# Altium schematic sheet Top_Sheet.SchDoc
size 420 x 297 mm; SheetNumber: 1; SheetTotal: 5
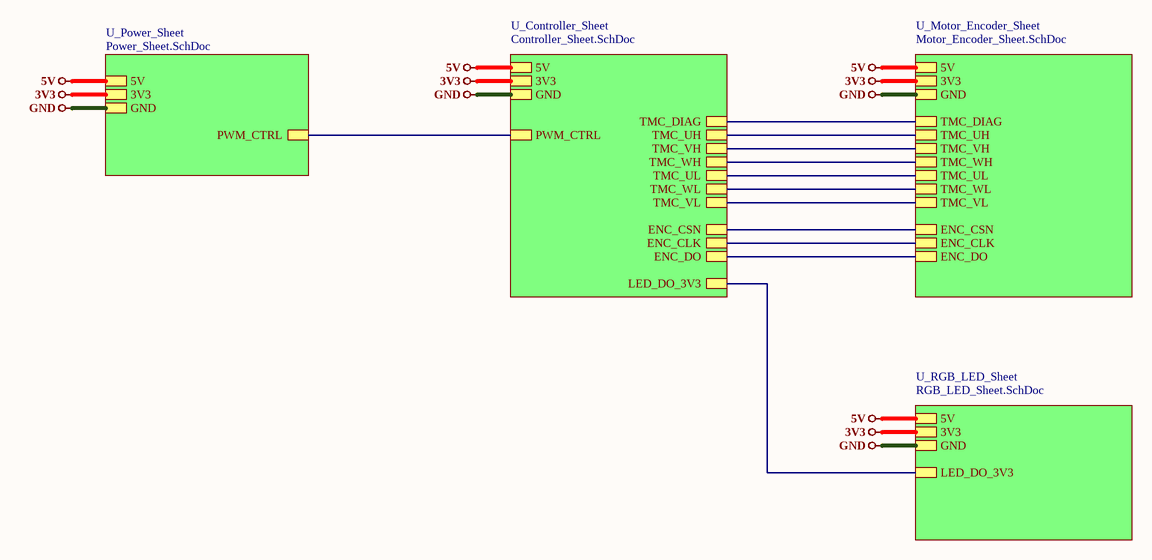
[diagram p0: Top_Sheet.SchDoc]

## Sub-sheets
U_Controller_Sheet = Controller_Sheet.SchDoc: 3V3, GND, 5V, TMC_UH, TMC_VH, TMC_WH, TMC_UL, TMC_WL, TMC_VL, ENC_CSN, ENC_CLK, ENC_DO, TMC_DIAG, PWM_CTRL, LED_DO_3V3
U_Motor_Encoder_Sheet = Motor_Encoder_Sheet.SchDoc: 3V3, GND, 5V, TMC_UH, TMC_VH, TMC_WH, TMC_UL, TMC_WL, TMC_VL, ENC_CSN, ENC_CLK, ENC_DO, TMC_DIAG
U_Power_Sheet = Power_Sheet.SchDoc: 3V3, GND, 5V, PWM_CTRL
U_RGB_LED_Sheet = RGB_LED_Sheet.SchDoc: 3V3, GND, 5V, LED_DO_3V3

## Nets
3V3: sheet U_Controller_Sheet/3V3, sheet U_Power_Sheet/3V3, sheet U_Motor_Encoder_Sheet/3V3, sheet U_RGB_LED_Sheet/3V3
5V: sheet U_Controller_Sheet/5V, sheet U_Power_Sheet/5V, sheet U_Motor_Encoder_Sheet/5V, sheet U_RGB_LED_Sheet/5V
GND: sheet U_Controller_Sheet/GND, sheet U_Power_Sheet/GND, sheet U_Motor_Encoder_Sheet/GND, sheet U_RGB_LED_Sheet/GND
(unnamed): sheet U_Controller_Sheet/TMC_UH, sheet U_Motor_Encoder_Sheet/TMC_UH
(unnamed): sheet U_Controller_Sheet/TMC_VH, sheet U_Motor_Encoder_Sheet/TMC_VH
(unnamed): sheet U_Controller_Sheet/TMC_WH, sheet U_Motor_Encoder_Sheet/TMC_WH
(unnamed): sheet U_Controller_Sheet/TMC_UL, sheet U_Motor_Encoder_Sheet/TMC_UL
(unnamed): sheet U_Controller_Sheet/TMC_WL, sheet U_Motor_Encoder_Sheet/TMC_WL
(unnamed): sheet U_Controller_Sheet/TMC_VL, sheet U_Motor_Encoder_Sheet/TMC_VL
(unnamed): sheet U_Controller_Sheet/ENC_CSN, sheet U_Motor_Encoder_Sheet/ENC_CSN
(unnamed): sheet U_Controller_Sheet/ENC_CLK, sheet U_Motor_Encoder_Sheet/ENC_CLK
(unnamed): sheet U_Controller_Sheet/ENC_DO, sheet U_Motor_Encoder_Sheet/ENC_DO
(unnamed): sheet U_Controller_Sheet/TMC_DIAG, sheet U_Motor_Encoder_Sheet/TMC_DIAG
(unnamed): sheet U_Controller_Sheet/PWM_CTRL, sheet U_Power_Sheet/PWM_CTRL
(unnamed): sheet U_Controller_Sheet/LED_DO_3V3, sheet U_RGB_LED_Sheet/LED_DO_3V3

## Notes on the sheet
- File:
- Title:
- Date:
- Page
- Num:
- Total:
- Drawn By: Huzaifa Ali